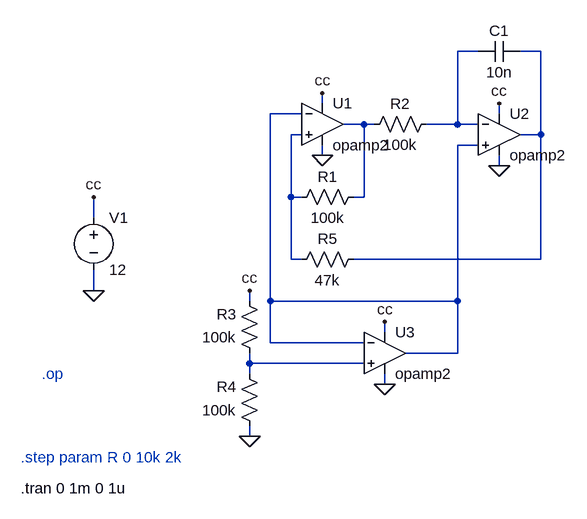
[diagram p0: schematic Draft1.asc]
Draft1.asc, the LTspice schematic file:
Version 4.1
SHEET 1 880 724
WIRE -80 0 -112 0
WIRE 16 0 -16 0
WIRE -320 80 -320 64
WIRE -352 96 -400 96
WIRE -48 96 -48 80
WIRE -256 112 -288 112
WIRE -240 112 -256 112
WIRE -112 112 -112 0
WIRE -112 112 -160 112
WIRE -80 112 -112 112
WIRE -352 128 -368 128
WIRE 16 128 16 0
WIRE 16 128 -16 128
WIRE -80 144 -112 144
WIRE -320 160 -320 144
WIRE -48 176 -48 160
WIRE -368 224 -368 128
WIRE -352 224 -368 224
WIRE -256 224 -256 112
WIRE -256 224 -272 224
WIRE -672 256 -672 224
WIRE -368 320 -368 224
WIRE -352 320 -368 320
WIRE 16 320 16 128
WIRE 16 320 -272 320
WIRE -672 368 -672 336
WIRE -432 384 -432 368
WIRE -400 384 -400 96
WIRE -112 384 -112 144
WIRE -112 384 -400 384
WIRE -224 432 -224 416
WIRE -400 448 -400 384
WIRE -256 448 -400 448
WIRE -112 464 -112 384
WIRE -112 464 -192 464
WIRE -432 480 -432 464
WIRE -256 480 -432 480
WIRE -432 496 -432 480
WIRE -224 512 -224 496
WIRE -432 592 -432 576
FLAG -320 160 0
FLAG -48 176 0
FLAG -224 512 0
FLAG -320 64 cc
FLAG -48 80 cc
FLAG -224 416 cc
FLAG -432 592 0
FLAG -432 368 cc
FLAG -672 224 cc
FLAG -672 368 0
SYMBOL res -256 208 R90
WINDOW 0 0 56 VBottom 2
WINDOW 3 32 56 VTop 2
SYMATTR InstName R1
SYMATTR Value 100k
SYMBOL res -144 96 R90
WINDOW 0 0 56 VBottom 2
WINDOW 3 32 56 VTop 2
SYMATTR InstName R2
SYMATTR Value 100k
SYMBOL res -416 480 R180
WINDOW 0 36 76 Left 2
WINDOW 3 36 40 Left 2
SYMATTR InstName R3
SYMATTR Value 100k
SYMBOL res -416 592 R180
WINDOW 0 36 76 Left 2
WINDOW 3 36 40 Left 2
SYMATTR InstName R4
SYMATTR Value 100k
SYMBOL res -256 304 R90
WINDOW 0 0 56 VBottom 2
WINDOW 3 32 56 VTop 2
SYMATTR InstName R5
SYMATTR Value 47k
SYMBOL voltage -672 240 R0
SYMATTR InstName V1
SYMATTR Value 12
SYMBOL cap -16 -16 R90
WINDOW 0 0 32 VBottom 2
WINDOW 3 32 32 VTop 2
SYMATTR InstName C1
SYMATTR Value 10n
SYMBOL OpAmps\\opamp2 -320 48 R0
SYMATTR InstName U1
SYMBOL OpAmps\\opamp2 -48 64 R0
SYMATTR InstName U2
SYMBOL OpAmps\\opamp2 -224 400 R0
SYMATTR InstName U3
TEXT -784 624 Left 2 ;.step param R 0 10k 2k
TEXT -752 496 Left 2 ;.op
TEXT -784 672 Left 2 !.tran 0 1m 0 1u

The netlist it stands for:
* Draft1.asc
R1 N004 N005 100k
R2 N001 N004 100k
R3 N006 cc 100k
R4 0 N006 100k
R5 N002 N005 47k
V1 cc 0 12
C1 N002 N001 10n
X§U1 N005 N003 cc 0 N004 opamp2  ; pins In+ In- V+ V- OUT
X§U2 N003 N001 cc 0 N002 opamp2  ; pins In+ In- V+ V- OUT
X§U3 N006 N003 cc 0 N003 opamp2  ; pins In+ In- V+ V- OUT
* .step param R 0 10k 2k
* .op
.tran 0 1m 0 1u
.backanno
.end